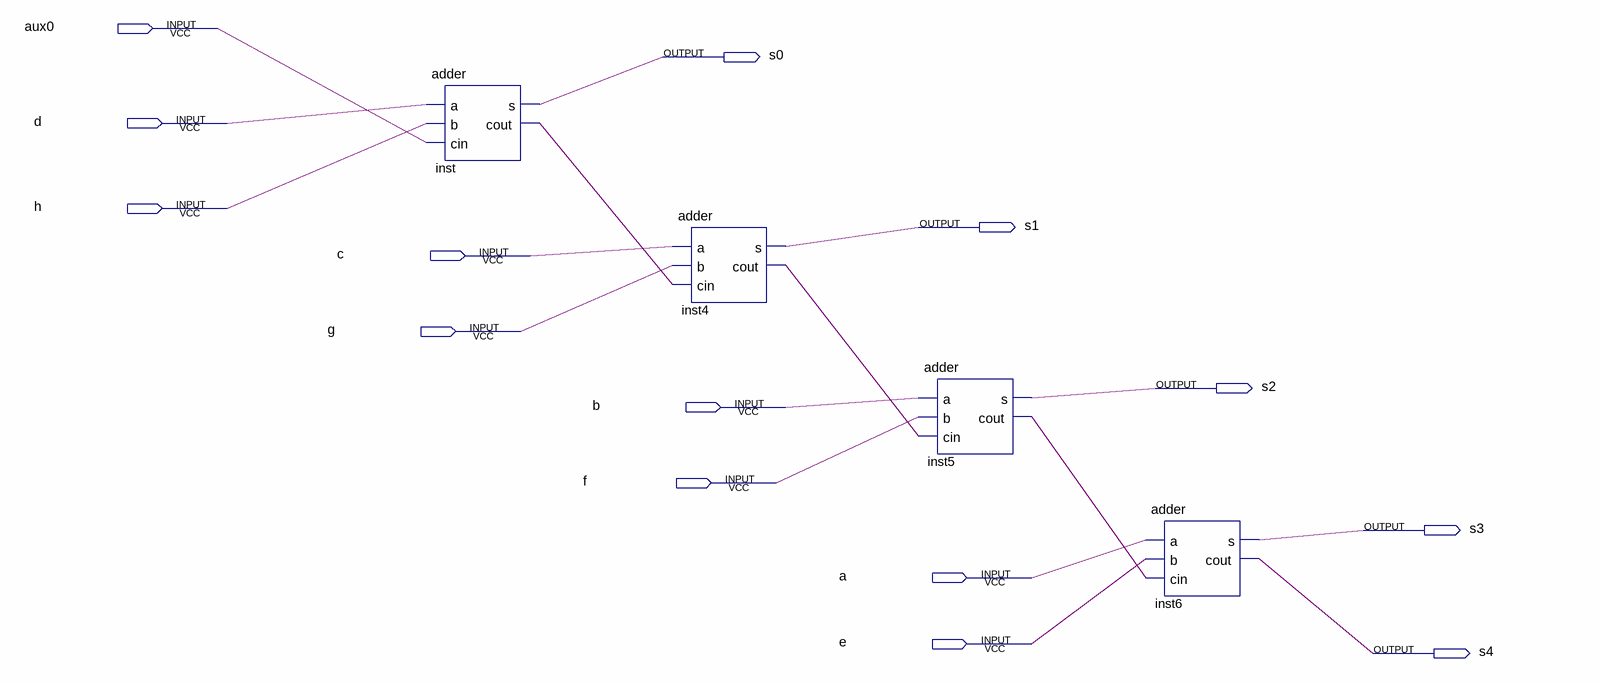
[diagram p0: schematic sheet]
// Quartus schematic adder4bits.bdf as structural Verilog: 4 symbols, 14 pins
module adder4bits (
  input  aux0,
  input  d,
  input  h,
  input  c,
  input  g,
  input  b,
  input  f,
  input  a,
  input  e,
  output s0,
  output s1,
  output s2,
  output s3,
  output s4
);

  wire inst4_cout, inst5_cout, inst_cout;

  adder inst (.a(d), .b(h), .cin(aux0), .s(s0), .cout(inst_cout));
  adder inst4 (.a(c), .b(g), .cin(inst_cout), .s(s1), .cout(inst4_cout));
  adder inst5 (.a(b), .b(f), .cin(inst4_cout), .s(s2), .cout(inst5_cout));
  adder inst6 (.a(a), .b(e), .cin(inst5_cout), .s(s3), .cout(s4));
endmodule
